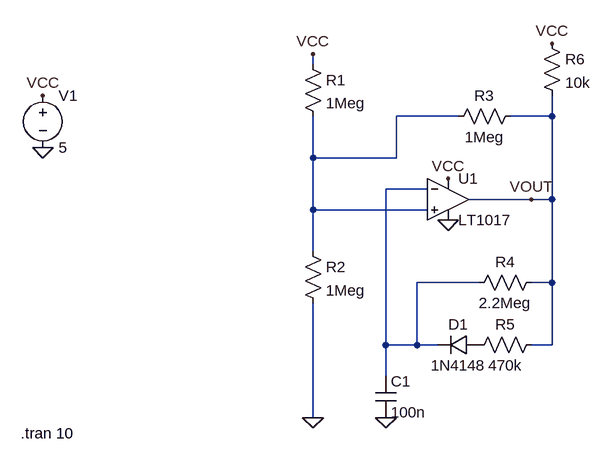
[diagram p0: schematic oscillator_opamp.asc]
oscillator_opamp.asc, the LTspice schematic file:
Version 4
SHEET 1 880 680
WIRE 0 -16 0 -32
WIRE 224 64 128 64
WIRE 368 64 368 32
WIRE 368 64 304 64
WIRE 0 128 0 64
WIRE 128 128 128 64
WIRE 128 128 0 128
WIRE 176 176 112 176
WIRE 336 192 240 192
WIRE 368 192 368 64
WIRE 368 192 336 192
WIRE 0 208 0 128
WIRE 176 208 0 208
WIRE 0 272 0 208
WIRE 256 320 160 320
WIRE 368 320 368 192
WIRE 368 320 336 320
WIRE 112 416 112 176
WIRE 160 416 160 320
WIRE 160 416 112 416
WIRE 192 416 160 416
WIRE 368 416 368 320
WIRE 368 416 336 416
WIRE 112 464 112 416
WIRE 0 528 0 352
FLAG -416 112 0
FLAG 208 224 0
FLAG -416 32 VCC
FLAG 208 160 VCC
FLAG 0 -32 VCC
FLAG 112 528 0
FLAG 0 528 0
FLAG 336 192 VOUT
FLAG 368 -48 VCC
SYMBOL Comparators\\LT1017 208 192 R0
SYMATTR InstName U1
SYMBOL cap 96 464 R0
SYMATTR InstName C1
SYMATTR Value 100n
SYMBOL res -16 -32 R0
SYMATTR InstName R1
SYMATTR Value 1Meg
SYMBOL res -16 256 R0
SYMATTR InstName R2
SYMATTR Value 1Meg
SYMBOL res 320 48 R90
WINDOW 0 0 56 VBottom 2
WINDOW 3 32 56 VTop 2
SYMATTR InstName R3
SYMATTR Value 1Meg
SYMBOL res 352 304 R90
WINDOW 0 0 56 VBottom 2
WINDOW 3 32 56 VTop 2
SYMATTR InstName R4
SYMATTR Value 2.2Meg
SYMBOL res 352 400 R90
WINDOW 0 0 56 VBottom 2
WINDOW 3 32 56 VTop 2
SYMATTR InstName R5
SYMATTR Value 470k
SYMBOL voltage -416 16 R0
WINDOW 123 0 0 Left 0
WINDOW 39 0 0 Left 0
SYMATTR InstName V1
SYMATTR Value 5
SYMBOL diode 256 400 R90
WINDOW 0 0 32 VBottom 2
WINDOW 3 32 32 VTop 2
SYMATTR InstName D1
SYMATTR Value 1N4148
SYMBOL res 352 -64 R0
SYMATTR InstName R6
SYMATTR Value 10k
TEXT -450 552 Left 2 !.tran 10

The netlist it stands for:
* oscillator_opamp.asc
XU1 N001 N002 VCC 0 VOUT LT1017  ; pins In+ In- V+ V- OUT
C1 N002 0 100n
R1 VCC N001 1Meg
R2 N001 0 1Meg
R3 VOUT N001 1Meg
R4 VOUT N002 2.2Meg
R5 VOUT P001 470k
V1 VCC 0 5
D1 P001 N002 1N4148
R6 VCC VOUT 10k
.model D D
.lib standard.dio
.tran 10
.backanno
.end